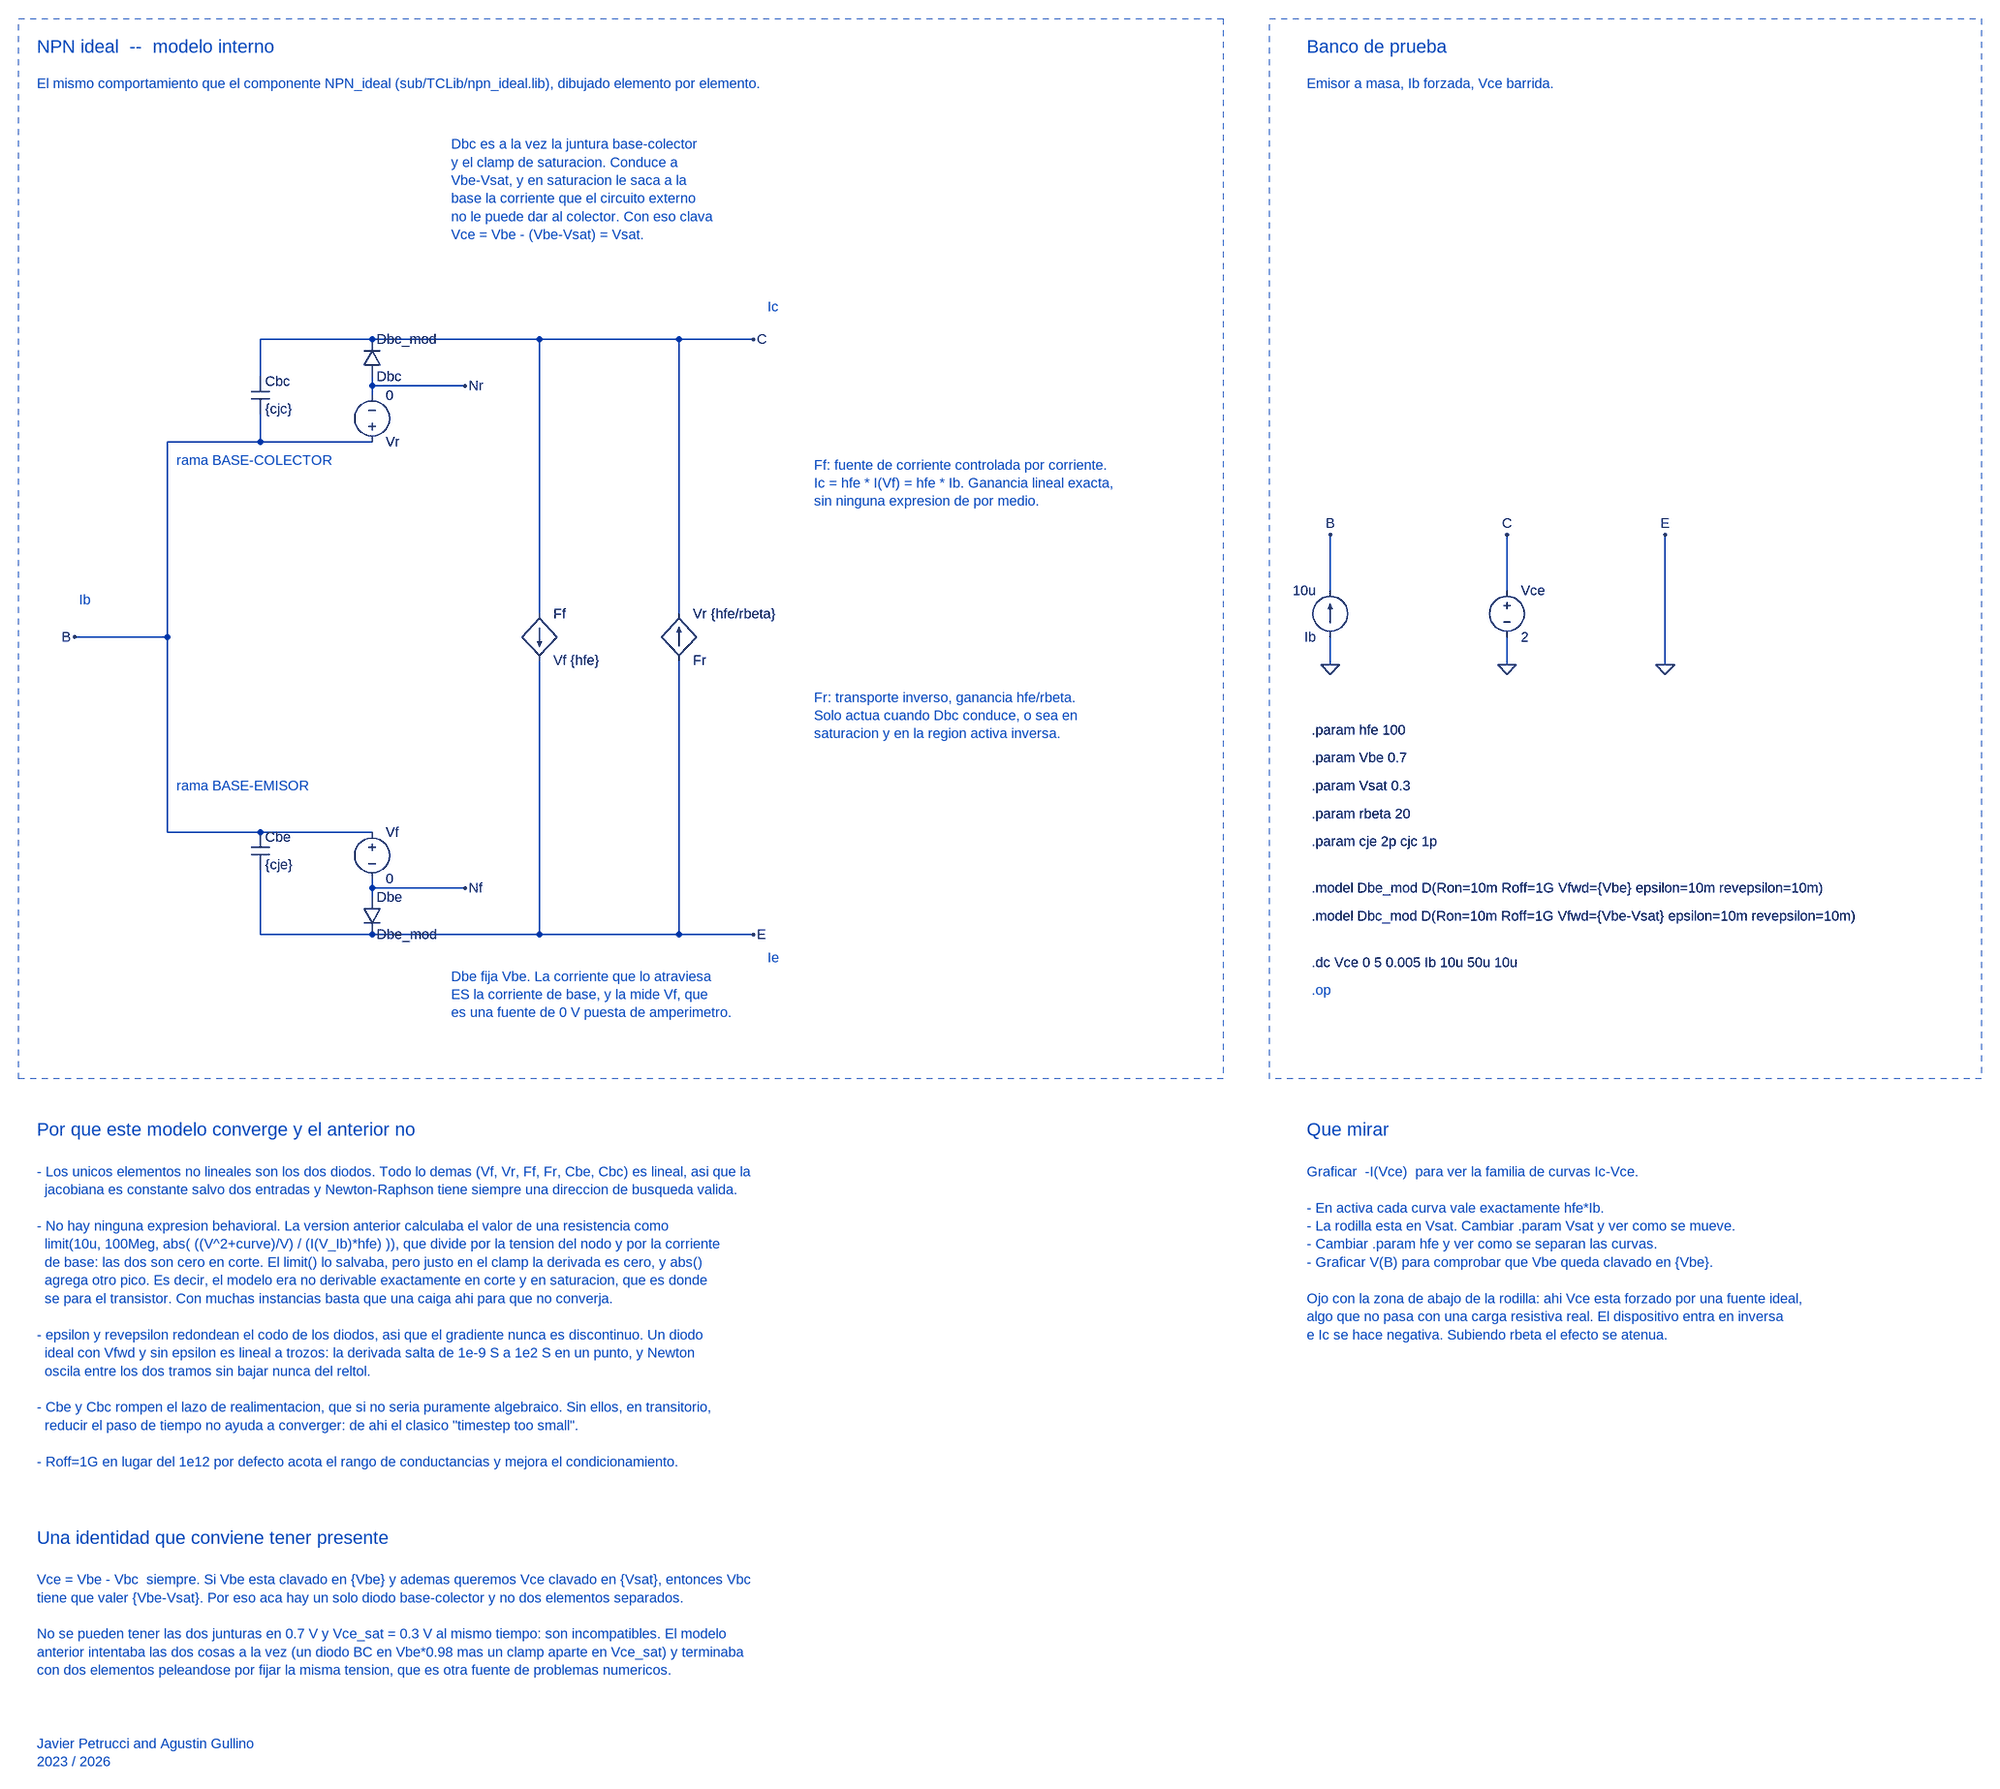
[diagram p0: schematic TC40b - BJT Ideal (modelo nuevo).asc]
TC40b - BJT Ideal (modelo nuevo).asc, the LTspice schematic file:
Version 4
SHEET 1 3200 2600
WIRE -160 -512 32 -512
WIRE 32 -512 320 -512
WIRE 320 -512 560 -512
WIRE 560 -512 688 -512
WIRE -160 512 32 512
WIRE 32 512 320 512
WIRE 320 512 560 512
WIRE 560 512 688 512
WIRE -320 -336 -160 -336
WIRE -160 -336 32 -336
WIRE -320 336 -160 336
WIRE -160 336 32 336
WIRE -320 -336 -320 0
WIRE -320 0 -320 336
WIRE -320 0 -480 0
WIRE 32 -416 32 -432
WIRE 32 -432 32 -448
WIRE 32 -432 192 -432
WIRE 32 416 32 432
WIRE 32 432 32 448
WIRE 32 432 192 432
WIRE 320 -512 320 -40
WIRE 320 40 320 512
WIRE 560 -512 560 -40
WIRE 560 40 560 512
WIRE -160 -512 -160 -448
WIRE -160 -384 -160 -336
WIRE -160 400 -160 512
WIRE 1680 -80 1680 -176
WIRE 1680 0 1680 48
WIRE 1984 -80 1984 -176
WIRE 1984 0 1984 48
WIRE 2256 -176 2256 48
FLAG -480 0 B
FLAG 688 -512 C
FLAG 688 512 E
FLAG 192 -432 Nr
FLAG 192 432 Nf
FLAG 1680 -176 B
FLAG 1680 48 0
FLAG 1984 -176 C
FLAG 1984 48 0
FLAG 2256 -176 E
FLAG 2256 48 0
SYMBOL voltage 32 -320 M180
WINDOW 123 0 0 Left 0
WINDOW 39 0 0 Left 0
SYMATTR InstName Vr
SYMATTR Value 0
SYMBOL diode 16 -448 M180
SYMATTR InstName Dbc
SYMATTR Value Dbc_mod
SYMBOL voltage 32 320 R0
WINDOW 123 0 0 Left 0
WINDOW 39 0 0 Left 0
SYMATTR InstName Vf
SYMATTR Value 0
SYMBOL diode 16 448 R0
SYMATTR InstName Dbe
SYMATTR Value Dbe_mod
SYMBOL f 320 -40 R0
SYMATTR InstName Ff
SYMATTR Value Vf {hfe}
SYMBOL f 560 40 M180
SYMATTR InstName Fr
SYMATTR Value Vr {hfe/rbeta}
SYMBOL cap -176 -448 R0
SYMATTR InstName Cbc
SYMATTR Value {cjc}
SYMBOL cap -176 336 R0
SYMATTR InstName Cbe
SYMATTR Value {cje}
SYMBOL current 1680 0 R180
WINDOW 123 0 0 Left 0
WINDOW 39 0 0 Left 0
SYMATTR InstName Ib
SYMATTR Value 10u
SYMBOL voltage 1984 -96 R0
WINDOW 123 0 0 Left 0
WINDOW 39 0 0 Left 0
SYMATTR InstName Vce
SYMATTR Value 2
TEXT -544 -1016 Left 3 ;NPN ideal  --  modelo interno
TEXT -544 -952 Left 2 ;El mismo comportamiento que el componente NPN_ideal (sub/TCLib/npn_ideal.lib), dibujado elemento por elemento.
TEXT 168 -848 Left 2 ;Dbc es a la vez la juntura base-colector\ny el clamp de saturacion. Conduce a\nVbe-Vsat, y en saturacion le saca a la\nbase la corriente que el circuito externo\nno le puede dar al colector. Con eso clava\nVce = Vbe - (Vbe-Vsat) = Vsat.
TEXT 168 584 Left 2 ;Dbe fija Vbe. La corriente que lo atraviesa\nES la corriente de base, y la mide Vf, que\nes una fuente de 0 V puesta de amperimetro.
TEXT 792 -296 Left 2 ;Ff: fuente de corriente controlada por corriente.\nIc = hfe * I(Vf) = hfe * Ib. Ganancia lineal exacta,\nsin ninguna expresion de por medio.
TEXT 792 104 Left 2 ;Fr: transporte inverso, ganancia hfe/rbeta.\nSolo actua cuando Dbc conduce, o sea en\nsaturacion y en la region activa inversa.
TEXT -304 -304 Left 2 ;rama BASE-COLECTOR
TEXT -304 256 Left 2 ;rama BASE-EMISOR
TEXT 712 -568 Left 2 ;Ic
TEXT 712 552 Left 2 ;Ie
TEXT -472 -64 Left 2 ;Ib
TEXT -544 848 Left 3 ;Por que este modelo converge y el anterior no
TEXT -544 920 Left 2 ;- Los unicos elementos no lineales son los dos diodos. Todo lo demas (Vf, Vr, Ff, Fr, Cbe, Cbc) es lineal, asi que la\n  jacobiana es constante salvo dos entradas y Newton-Raphson tiene siempre una direccion de busqueda valida.\n \n- No hay ninguna expresion behavioral. La version anterior calculaba el valor de una resistencia como\n  limit(10u, 100Meg, abs( ((V^2+curve)/V) / (I(V_Ib)*hfe) )), que divide por la tension del nodo y por la corriente\n  de base: las dos son cero en corte. El limit() lo salvaba, pero justo en el clamp la derivada es cero, y abs()\n  agrega otro pico. Es decir, el modelo era no derivable exactamente en corte y en saturacion, que es donde\n  se para el transistor. Con muchas instancias basta que una caiga ahi para que no converja.\n \n- epsilon y revepsilon redondean el codo de los diodos, asi que el gradiente nunca es discontinuo. Un diodo\n  ideal con Vfwd y sin epsilon es lineal a trozos: la derivada salta de 1e-9 S a 1e2 S en un punto, y Newton\n  oscila entre los dos tramos sin bajar nunca del reltol.\n \n- Cbe y Cbc rompen el lazo de realimentacion, que si no seria puramente algebraico. Sin ellos, en transitorio,\n  reducir el paso de tiempo no ayuda a converger: de ahi el clasico "timestep too small".\n \n- Roff=1G en lugar del 1e12 por defecto acota el rango de conductancias y mejora el condicionamiento.
TEXT -544 1560 Left 3 ;Una identidad que conviene tener presente
TEXT -544 1632 Left 2 ;Vce = Vbe - Vbc  siempre. Si Vbe esta clavado en {Vbe} y ademas queremos Vce clavado en {Vsat}, entonces Vbc\ntiene que valer {Vbe-Vsat}. Por eso aca hay un solo diodo base-colector y no dos elementos separados.\n \nNo se pueden tener las dos junturas en 0.7 V y Vce_sat = 0.3 V al mismo tiempo: son incompatibles. El modelo\nanterior intentaba las dos cosas a la vez (un diodo BC en Vbe*0.98 mas un clamp aparte en Vce_sat) y terminaba\ncon dos elementos peleandose por fijar la misma tension, que es otra fuente de problemas numericos.
TEXT 1640 -1016 Left 3 ;Banco de prueba
TEXT 1640 -952 Left 2 ;Emisor a masa, Ib forzada, Vce barrida.
TEXT 1648 160 Left 2 !.param hfe 100
TEXT 1648 208 Left 2 !.param Vbe 0.7
TEXT 1648 256 Left 2 !.param Vsat 0.3
TEXT 1648 304 Left 2 !.param rbeta 20
TEXT 1648 352 Left 2 !.param cje 2p cjc 1p
TEXT 1648 432 Left 2 !.model Dbe_mod D(Ron=10m Roff=1G Vfwd={Vbe} epsilon=10m revepsilon=10m)
TEXT 1648 480 Left 2 !.model Dbc_mod D(Ron=10m Roff=1G Vfwd={Vbe-Vsat} epsilon=10m revepsilon=10m)
TEXT 1648 560 Left 2 !.dc Vce 0 5 0.005 Ib 10u 50u 10u
TEXT 1648 608 Left 2 ;.op
TEXT 1640 848 Left 3 ;Que mirar
TEXT 1640 920 Left 2 ;Graficar  -I(Vce)  para ver la familia de curvas Ic-Vce.\n \n- En activa cada curva vale exactamente hfe*Ib.\n- La rodilla esta en Vsat. Cambiar .param Vsat y ver como se mueve.\n- Cambiar .param hfe y ver como se separan las curvas.\n- Graficar V(B) para comprobar que Vbe queda clavado en {Vbe}.\n \nOjo con la zona de abajo de la rodilla: ahi Vce esta forzado por una fuente ideal,\nalgo que no pasa con una carga resistiva real. El dispositivo entra en inversa\ne Ic se hace negativa. Subiendo rbeta el efecto se atenua.
TEXT -544 2016 Left 2 ;Javier Petrucci and Agustin Gullino\n2023 / 2026
RECTANGLE Normal 1496 760 -576 -1064 2
RECTANGLE Normal 2800 760 1576 -1064 2

The netlist it stands for:
* TC40b - BJT Ideal (modelo nuevo).asc
Vr B Nr 0
Dbc Nr C Dbc_mod
Vf B Nf 0
Dbe Nf 0 Dbe_mod
Ff C 0 Vf {hfe}
Fr 0 C Vr {hfe/rbeta}
Cbc C B {cjc}
Cbe B 0 {cje}
Ib 0 B 10u
Vce C 0 2
.model D D
.lib standard.dio
* NPN ideal  --  modelo interno
* El mismo comportamiento que el componente NPN_ideal (sub/TCLib/npn_ideal.lib), dibujado elemento por elemento.
* Dbc es a la vez la juntura base-colector
* y el clamp de saturacion. Conduce a
* Vbe-Vsat, y en saturacion le saca a la
* base la corriente que el circuito externo
* no le puede dar al colector. Con eso clava
* Vce = Vbe - (Vbe-Vsat) = Vsat.
* Dbe fija Vbe. La corriente que lo atraviesa
* ES la corriente de base, y la mide Vf, que
* es una fuente de 0 V puesta de amperimetro.
* Ff: fuente de corriente controlada por corriente.
* Ic = hfe * I(Vf) = hfe * Ib. Ganancia lineal exacta,
* sin ninguna expresion de por medio.
* Fr: transporte inverso, ganancia hfe/rbeta.
* Solo actua cuando Dbc conduce, o sea en
* saturacion y en la region activa inversa.
* rama BASE-COLECTOR
* rama BASE-EMISOR
* Ic
* Ie
* Ib
* Por que este modelo converge y el anterior no
* - Los unicos elementos no lineales son los dos diodos. Todo lo demas (Vf, Vr, Ff, Fr, Cbe, Cbc) es lineal, asi que la
*   jacobiana es constante salvo dos entradas y Newton-Raphson tiene siempre una direccion de busqueda valida.
* - No hay ninguna expresion behavioral. La version anterior calculaba el valor de una resistencia como
*   limit(10u, 100Meg, abs( ((V^2+curve)/V) / (I(V_Ib)*hfe) )), que divide por la tension del nodo y por la corriente
*   de base: las dos son cero en corte. El limit() lo salvaba, pero justo en el clamp la derivada es cero, y abs()
*   agrega otro pico. Es decir, el modelo era no derivable exactamente en corte y en saturacion, que es donde
*   se para el transistor. Con muchas instancias basta que una caiga ahi para que no converja.
* - epsilon y revepsilon redondean el codo de los diodos, asi que el gradiente nunca es discontinuo. Un diodo
*   ideal con Vfwd y sin epsilon es lineal a trozos: la derivada salta de 1e-9 S a 1e2 S en un punto, y Newton
*   oscila entre los dos tramos sin bajar nunca del reltol.
* - Cbe y Cbc rompen el lazo de realimentacion, que si no seria puramente algebraico. Sin ellos, en transitorio,
*   reducir el paso de tiempo no ayuda a converger: de ahi el clasico "timestep too small".
* - Roff=1G en lugar del 1e12 por defecto acota el rango de conductancias y mejora el condicionamiento.
* Una identidad que conviene tener presente
* Vce = Vbe - Vbc  siempre. Si Vbe esta clavado en {Vbe} y ademas queremos Vce clavado en {Vsat}, entonces Vbc
* tiene que valer {Vbe-Vsat}. Por eso aca hay un solo diodo base-colector y no dos elementos separados.
* No se pueden tener las dos junturas en 0.7 V y Vce_sat = 0.3 V al mismo tiempo: son incompatibles. El modelo
* anterior intentaba las dos cosas a la vez (un diodo BC en Vbe*0.98 mas un clamp aparte en Vce_sat) y terminaba
* con dos elementos peleandose por fijar la misma tension, que es otra fuente de problemas numericos.
* Banco de prueba
* Emisor a masa, Ib forzada, Vce barrida.
.param hfe 100
.param Vbe 0.7
.param Vsat 0.3
.param rbeta 20
.param cje 2p cjc 1p
.model Dbe_mod D(Ron=10m Roff=1G Vfwd={Vbe} epsilon=10m revepsilon=10m)
.model Dbc_mod D(Ron=10m Roff=1G Vfwd={Vbe-Vsat} epsilon=10m revepsilon=10m)
.dc Vce 0 5 0.005 Ib 10u 50u 10u
* .op
* Que mirar
* Graficar  -I(Vce)  para ver la familia de curvas Ic-Vce.
* - En activa cada curva vale exactamente hfe*Ib.
* - La rodilla esta en Vsat. Cambiar .param Vsat y ver como se mueve.
* - Cambiar .param hfe y ver como se separan las curvas.
* - Graficar V(B) para comprobar que Vbe queda clavado en {Vbe}.
* Ojo con la zona de abajo de la rodilla: ahi Vce esta forzado por una fuente ideal,
* algo que no pasa con una carga resistiva real. El dispositivo entra en inversa
* e Ic se hace negativa. Subiendo rbeta el efecto se atenua.
* Javier Petrucci and Agustin Gullino
* 2023 / 2026
.backanno
.end